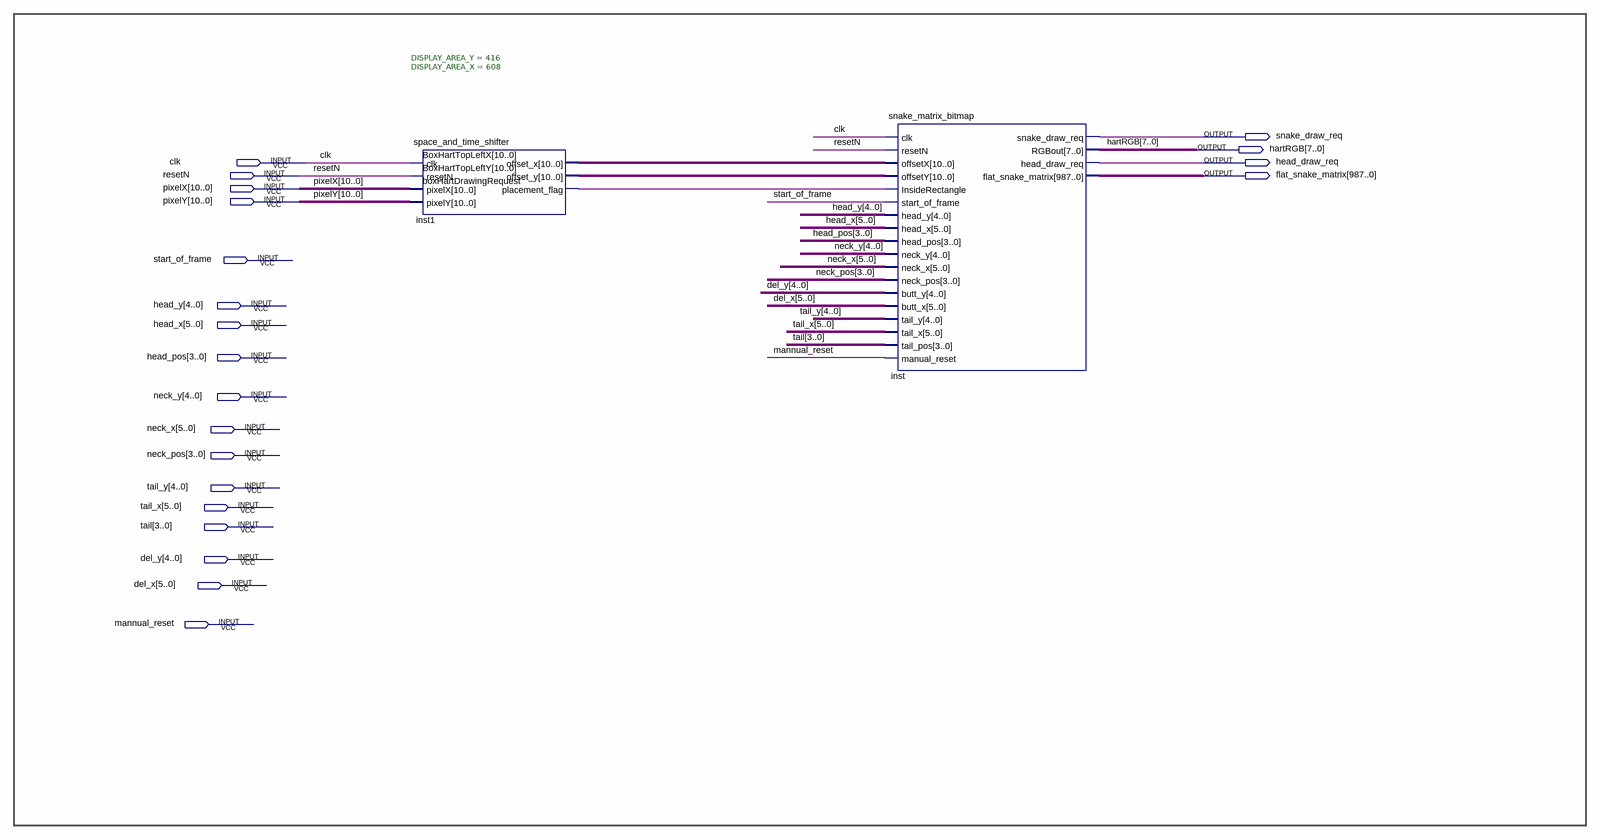
[diagram p0: schematic sheet]
// Quartus schematic SNAKE_DISPLAY.bdf as structural Verilog: 2 symbols, 21 pins
module SNAKE_DISPLAY (
  input  clk,
  input  resetN,
  input  [10:0] pixelX,
  input  [10:0] pixelY,
  input  start_of_frame,
  input  [4:0] head_y,
  input  [5:0] head_x,
  input  [3:0] head_pos,
  input  [4:0] neck_y,
  input  [5:0] neck_x,
  input  [3:0] neck_pos,
  input  [4:0] tail_y,
  input  [5:0] tail_x,
  input  [3:0] tail,
  input  [4:0] del_y,
  input  [5:0] del_x,
  input  mannual_reset,
  output snake_draw_req,
  output [7:0] hartRGB,
  output head_draw_req,
  output [987:0] flat_snake_matrix
);

  wire boxHartDrawingRequest;
  wire [10:0] BoxHartTopLeftX, BoxHartTopLeftY;

  space_and_time_shifter #(.DISPLAY_AREA_Y(416), .DISPLAY_AREA_X(608)) inst1 (
    .clk(clk), .resetN(resetN), .pixelX(pixelX), .pixelY(pixelY), .offset_x(BoxHartTopLeftX),
    .offset_y(BoxHartTopLeftY), .placement_flag(boxHartDrawingRequest));
  snake_matrix_bitmap inst (
    .clk(clk), .resetN(resetN), .offsetX(BoxHartTopLeftX), .offsetY(BoxHartTopLeftY),
    .InsideRectangle(boxHartDrawingRequest), .start_of_frame(start_of_frame), .head_y(head_y),
    .head_x(head_x), .head_pos(head_pos), .neck_y(neck_y), .neck_x(neck_x), .neck_pos(neck_pos),
    .butt_y(del_y), .butt_x(del_x), .tail_y(tail_y), .tail_x(tail_x), .tail_pos(tail),
    .manual_reset(mannual_reset), .snake_draw_req(snake_draw_req), .RGBout(hartRGB),
    .head_draw_req(head_draw_req), .flat_snake_matrix(flat_snake_matrix));
endmodule
